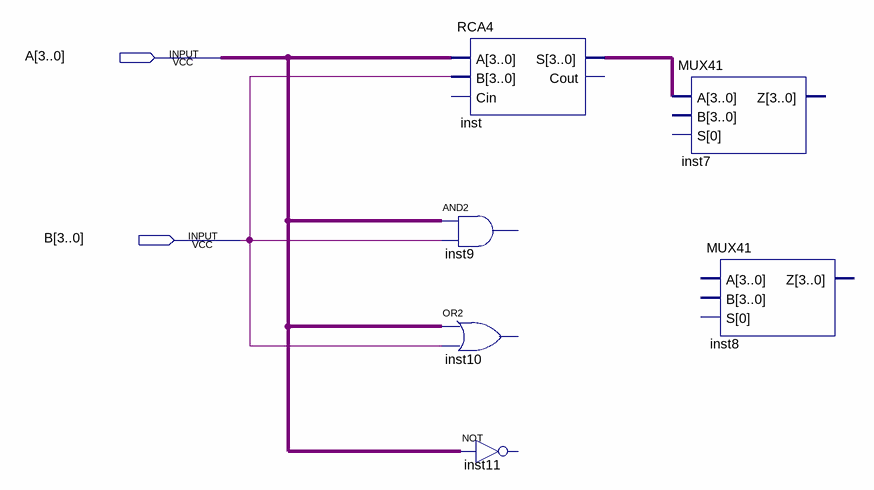
[diagram p0: schematic sheet]
// Quartus schematic ULA.bdf as structural Verilog: 6 symbols, 2 pins
module ULA (
  input  [3:0] A,
  input  [3:0] B
);

  wire undriven;
  wire [3:0] inst_s;

  RCA4 inst (.A(A), .B({4{undriven}}), .S(inst_s));  // open: Cin, Cout
  // AND2 inst9 has open pins: IN1=A, IN2=undriven, OUT=open
  // OR2 inst10 has open pins: IN1=A, IN2=undriven, OUT=open
  // NOT inst11 has open pins: IN=A, OUT=open
  MUX41 inst7 (.A(inst_s));  // open: B, S, Z
  MUX41 inst8 ();  // open: A, B, S, Z
endmodule
